# Altium schematic sheet micro_sd.SchDoc
size A3; SheetNumber: 14; SheetTotal: 18
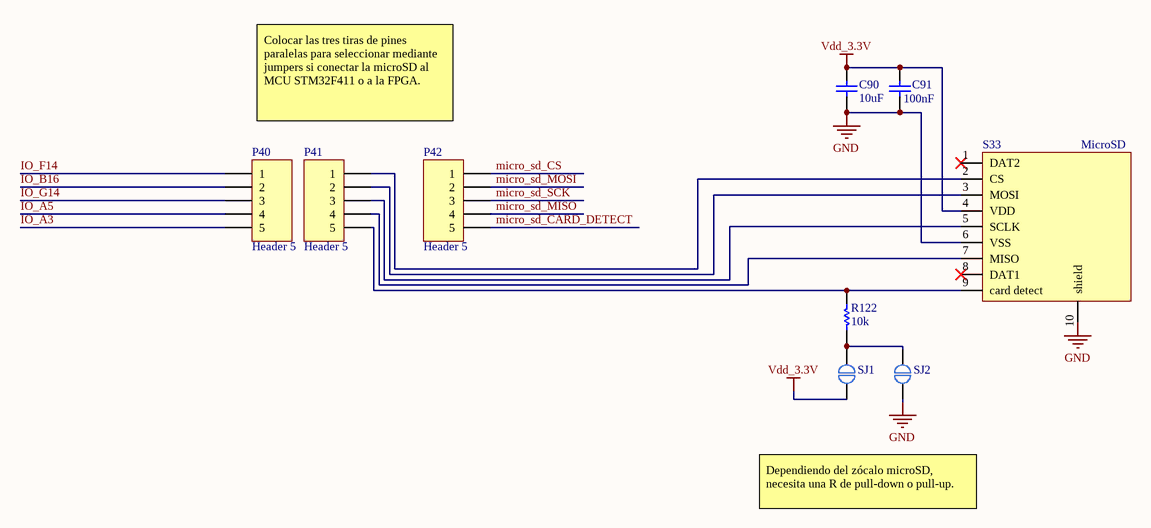
[diagram p0: micro_sd.SchDoc]

## Parts
C90  value 10uF  [capacitor 0603]  (hidden comment: ceramic capacitor)
C91  value 100nF  [capacitor 0603]  (hidden comment: Ceramic capacitor)
P40  Header 5  [HDR1X5]
P41  Header 5  [HDR1X5]
P42  Header 5  [HDR1X5]
R122  value 10k  [resistor 0603]  (hidden comment: resistor)
S33  MicroSD  [Micro sd]
SJ1  Solder jumper NO  [normally open solder jumper]  (value not drawn)
SJ2  Solder jumper NO  [normally open solder jumper]  (value not drawn)

## Nets
GND: C90.1 C91.1 S33.6(VSS) S33.10(shield) SJ2.1
Vdd_3.3V: C90.2 C91.2 S33.4(VDD) SJ1.1
IO_A3: P40.5
IO_A5: P40.4
IO_B16: P40.2
IO_F14: P40.1
IO_G14: P40.3
micro_sd_CARD_DETECT: P42.5
micro_sd_CS: P42.1
micro_sd_MISO: P42.4
micro_sd_MOSI: P42.2
micro_sd_SCK: P42.3
NetP41_1: P41.1 S33.2(CS)
NetP41_2: P41.2 S33.3(MOSI)
NetP41_3: P41.3 S33.5(SCLK)
NetP41_4: P41.4 S33.7(MISO)
NetP41_5: P41.5 R122.1 S33.9(card_detect)
NetR122_2: R122.2 SJ1.2 SJ2.2

Not connected (* = marked no-connect by the designer): S33 1(DAT2)* 8(DAT1)*

## Notes on the sheet
- Colocar las tres tiras de pines paralelas para seleccionar mediante jumpers si conectar la microSD al MCU STM32F411 o a la FPGA.
- Dependiendo del zócalo microSD, necesita una R de pull-down o pull-up.

## Library data of the parts
C90 = ceramic capacitor: Multilayer ceramic capacitor; V: 6.3; LCSC part: C1691; Package: 0603
C91 = Ceramic capacitor: Multilayer ceramic capacitor; V: 50; LCSC part: C14663; Package: 0603
P40-P42 = Header 5: Header, 5-Pin; LatestRevisionDate: 17-Jul-2002; LatestRevisionNote: Re-released for DXP Platform.; Publisher: Altium Limited
S33 = Micro SD: Micro SD memory
SJ1 SJ2 = Solder jumper NO: Normally open solder jumper
R122 = resistor: Package: 0603